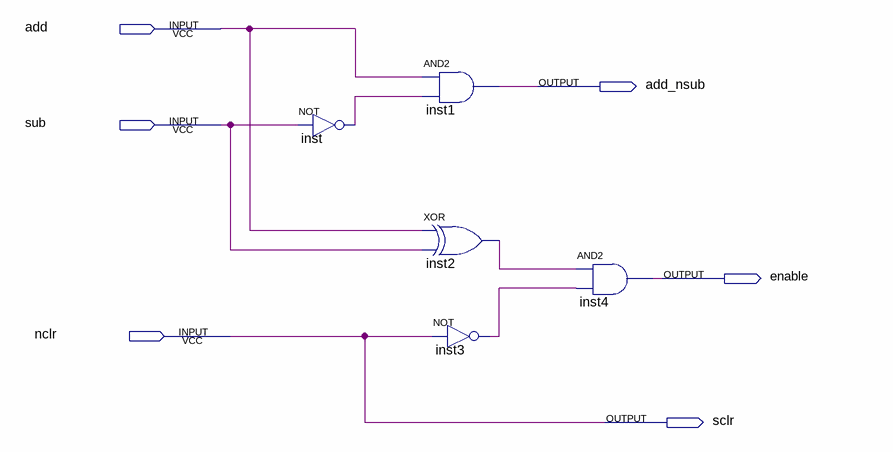
[diagram p0: schematic sheet]
// Quartus schematic module_add_sub.bdf as structural Verilog: 5 symbols, 6 pins
module module_add_sub (
  input  add,
  input  sub,
  input  nclr,
  output add_nsub,
  output enable,
  output sclr
);

  wire inst2_out, inst3_out, inst_out;

  not inst (inst_out, sub);
  and inst1 (add_nsub, add, inst_out);
  xor inst2 (inst2_out, add, sub);
  not inst3 (inst3_out, nclr);
  and inst4 (enable, inst2_out, inst3_out);

  assign sclr = nclr;
endmodule
